# EAGLE design Melting Point (EAGLE 9.7.0)
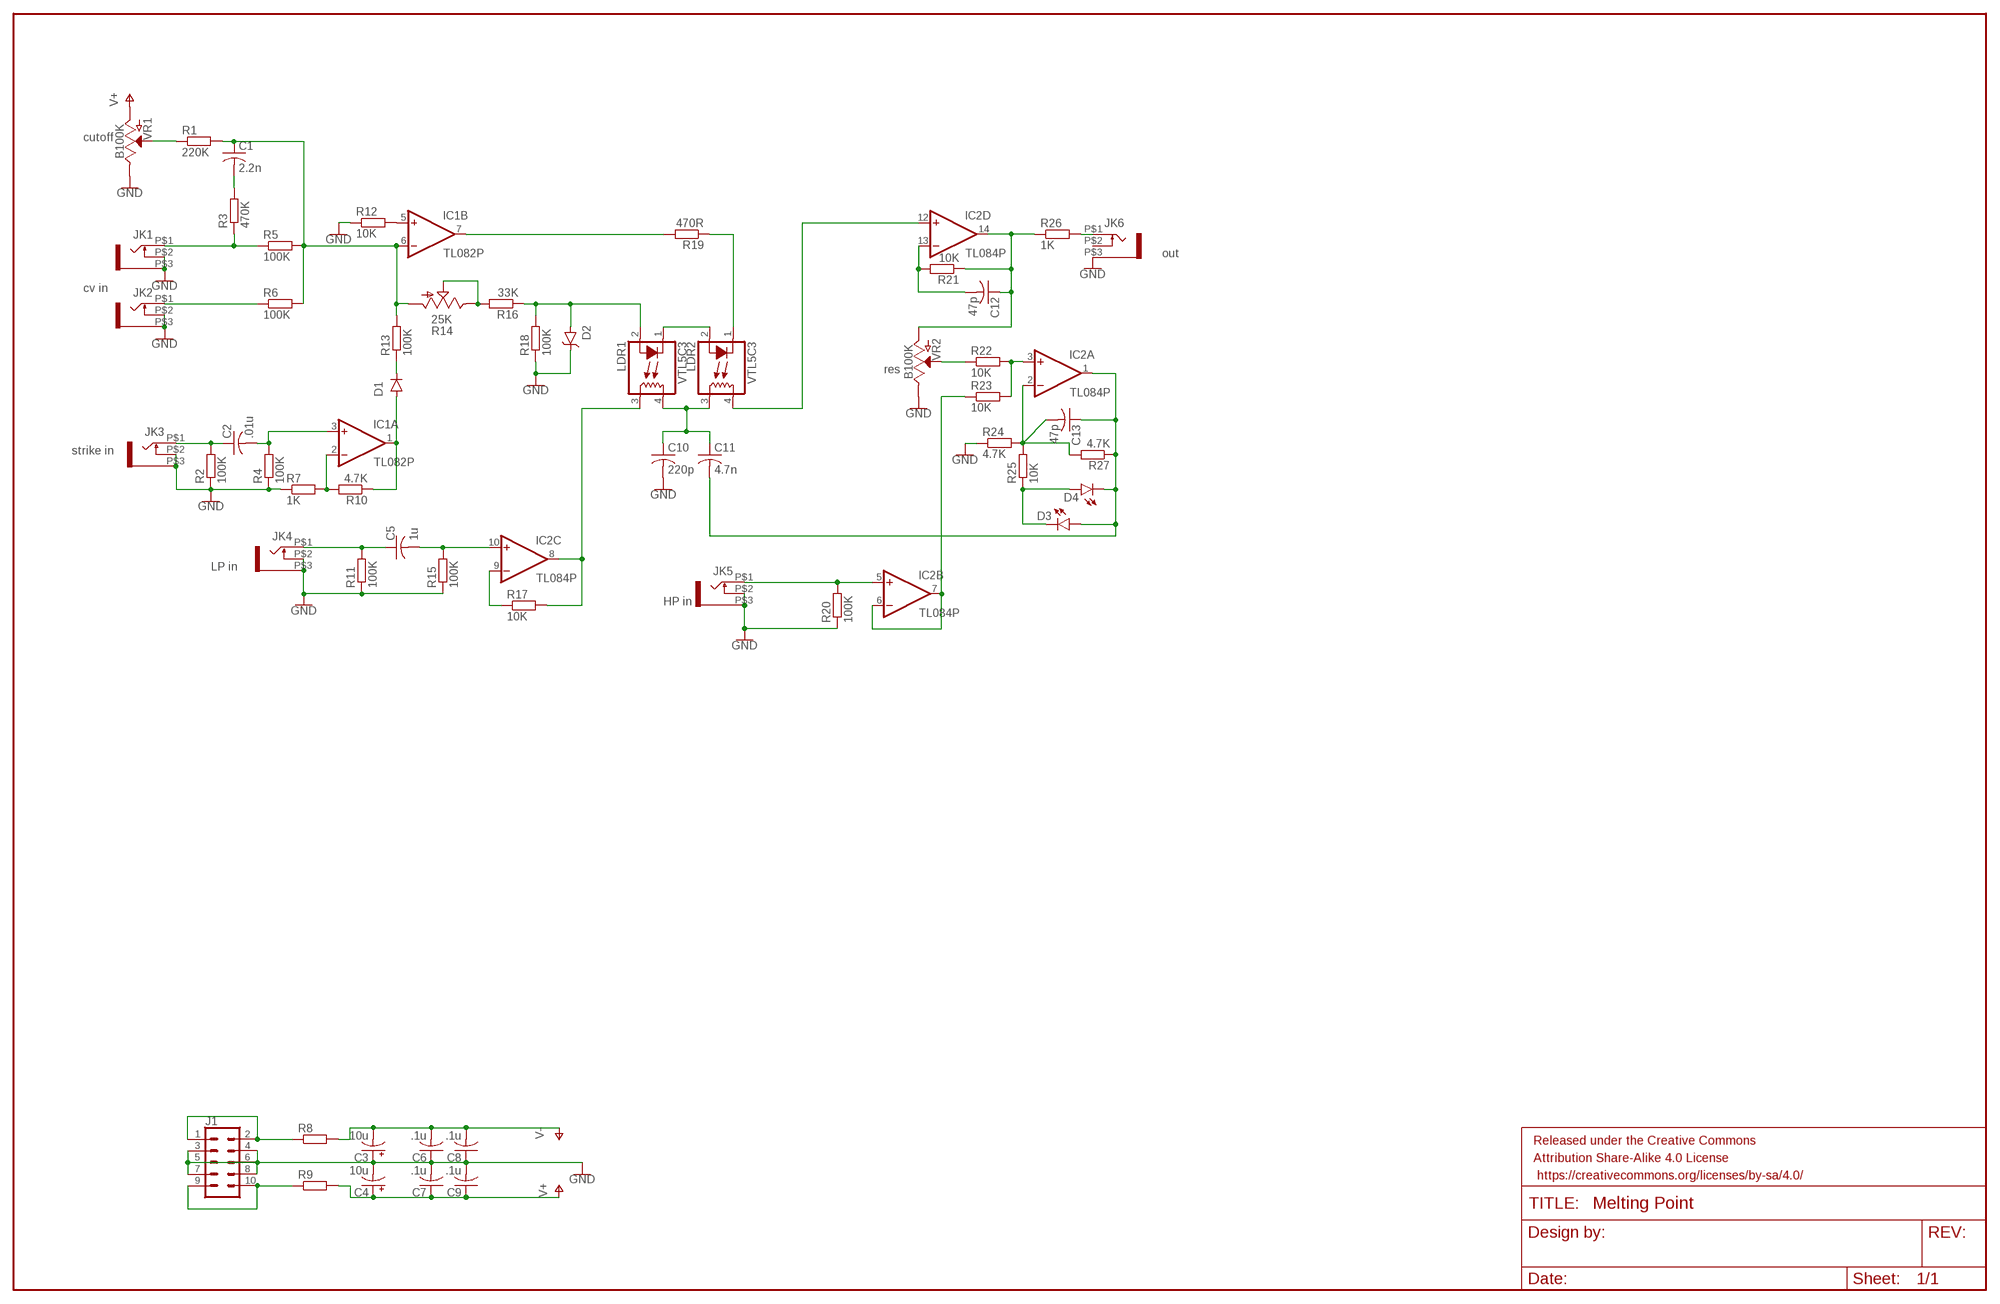
[diagram p0: schematic, sheet 1]

## Parts
C1  2.2n  C-US025-025X050  [C025-025X050]
C2  .01u  C-US025-025X050  [C025-025X050]
C3  10u  CPOL-USE2.5-6  [E2,5-6]
C4  10u  CPOL-USE2.5-6  [E2,5-6]
C5  1u  C-US050-045X075  [C050-045X075]
C6  .1u  C-US025-025X050  [C025-025X050]
C7  .1u  C-US025-025X050  [C025-025X050]
C8  .1u  C-US025-025X050  [C025-025X050]
C9  .1u  C-US025-025X050  [C025-025X050]
C10  220p  C-US050-025X075  [C050-025X075]
C11  4.7n  C-US050-025X075  [C050-025X075]
C12  47p  C-US025-025X050  [C025-025X050]
C13  47p  C-US025-025X050  [C025-025X050]
D1  1N4148DO35-7  [DO35-7]
D2  1N4732A-TAP  [DO-41]
D3  LED3MM  [LED_3MM]
D4  LED3MM  [LED_3MM]
FRAME1  FRAME-LEDGERNO_FOOTPRINT  [DUMMY]
IC1  TL082P  [DIL08]
IC2  TL084P  [DIL14]
J1  CONN_05X2PTH  [2X5]
JK1  WQP-PJ301M-12_JACK  [WQP-PJ301M-12_JACK]
JK2  WQP-PJ301M-12_JACK  [WQP-PJ301M-12_JACK]
JK3  WQP-PJ301M-12_JACK  [WQP-PJ301M-12_JACK]
JK4  WQP-PJ301M-12_JACK  [WQP-PJ301M-12_JACK]
JK5  WQP-PJ301M-12_JACK  [WQP-PJ301M-12_JACK]
JK6  WQP-PJ301M-12_JACK  [WQP-PJ301M-12_JACK]
LDR1  VTL5C3  VTL5C9  [VTL5C]
LDR2  VTL5C3  VTL5C9  [VTL5C]
R1  220K  R-EU_0207/10  [0207/10]
R2  100K  R-EU_0207/10  [0207/10]
R3  470K  R-EU_0207/10  [0207/10]
R4  100K  R-EU_0207/10  [0207/10]
R5  100K  R-EU_0207/10  [0207/10]
R6  100K  R-EU_0207/10  [0207/10]
R7  1K  R-EU_0207/10  [0207/10]
R8  R-EU_0207/10  [0207/10]
R9  R-EU_0207/10  [0207/10]
R10  4.7K  R-EU_0207/10  [0207/10]
R11  100K  R-EU_0207/10  [0207/10]
R12  10K  R-EU_0207/10  [0207/10]
R13  100K  R-EU_0207/10  [0207/10]
R14  25K  TRIM_US-CA6V  [CA6V]
R15  100K  R-EU_0207/10  [0207/10]
R16  33K  R-EU_0207/10  [0207/10]
R17  10K  R-EU_0207/10  [0207/10]
R18  100K  R-EU_0207/10  [0207/10]
R19  470R  R-EU_0207/10  [0207/10]
R20  100K  R-EU_0207/10  [0207/10]
R21  10K  R-EU_0207/10  [0207/10]
R22  10K  R-EU_0207/10  [0207/10]
R23  10K  R-EU_0207/10  [0207/10]
R24  4.7K  R-EU_0207/10  [0207/10]
R25  10K  R-EU_0207/10  [0207/10]
R26  1K  R-EU_0207/10  [0207/10]
R27  4.7K  R-EU_0207/10  [0207/10]
VR1  B100K  POTENTIOMETER-PTH-9MM-1/20W-20%  [POT-PTH-ALPS]
VR2  B100K  POTENTIOMETER-PTH-9MM-1/20W-20%  [POT-PTH-ALPS]

## Nets
GND: C3.+ C4.- C6.1 C7.2 C8.1 C9.2 C10.2 D2.C J1.3 J1.4 J1.5 J1.6 J1.7 J1.8 JK1.P$2 JK1.P$3 JK2.P$2 JK2.P$3 JK3.P$2 JK3.P$3 JK4.P$2 JK4.P$3 JK5.P$2 JK5.P$3 JK6.P$3 R2.1 R4.1 R7.1 R11.1 R12.1 R15.1 R18.1 R20.1 R24.1 VR1.P$1(E) VR2.P$1(E)
N$1: J1.1 J1.2 R8.1
N$2: J1.9 J1.10 R9.1
N$3: D1.A IC1.1(A:OUT) R10.1
N$4: JK2.P$1 R6.1
N$5: IC1.5(B:+IN) R12.2
N$6: C2.1 JK3.P$1 R2.2
N$7: C2.2 IC1.3(A:+IN) R4.2
N$8: C12.1 IC2.14(D:OUT) R21.1 R26.1 VR2.P$3(A)
N$9: IC1.2(A:-IN) R7.2 R10.2
N$10: R22.1 VR2.P$2(S)
N$12: D1.C R13.1
N$14: IC2.5(B:+IN) JK5.P$1 R20.2
N$16: IC2.6(B:-IN) IC2.7(B:OUT) R23.1
N$21: C11.2 C13.1 D3.A D4.K(C) IC2.1(A:OUT) R27.1
N$29: C1.1 IC1.6(B:-IN) R1.2 R5.2 R6.2 R13.2 R14.A
N$30: D3.K(C) D4.A R25.1
N$31: R14.E R14.S R16.2
N$34: D2.A LDR1.2(A) R16.1 R18.2
N$35: LDR1.1(C) LDR2.2(A)
N$36: IC1.7(B:OUT) R19.2
N$37: LDR2.1(C) R19.1
N$39: C5.2 IC2.10(C:+IN) R15.2
N$40: IC2.9(C:-IN) R17.1
N$41: IC2.8(C:OUT) LDR1.3(L1) R17.2
N$42: C10.1 C11.1 LDR1.4(L2) LDR2.3(L1)
N$43: IC2.12(D:+IN) LDR2.4(L2)
N$44: C12.2 IC2.13(D:-IN) R21.2
N$45: IC2.3(A:+IN) R22.2 R23.2
N$47: C13.2 IC2.2(A:-IN) R24.2 R25.2 R27.2
N$57: R1.1 VR1.P$2(S)
N$59: JK1.P$1 R3.1 R5.1
N$60: C1.2 R3.2
N$61: C5.1 JK4.P$1 R11.2
N$64: JK6.P$1 R26.2
V+: C4.+ C7.1 C9.1 R9.2 VR1.P$3(A)
V-: C3.- C6.2 C8.2 R8.2
Unconnected: JK6.P$2

## Notes on the sheet
- cutoff
- out
- cv in
- res
- strike in
- LP in
- HP in

## Power pins joined to a net without a drawn wire
V+: IC1.8(P:V+) IC2.4(P:V+)
V-: IC1.4(P:V-) IC2.11(P:V-)

## Library data of the parts
C1 C2 C5-C13 = rcl:C-US: CAPACITOR, American symbol; SPICEPREFIX: C
C3 C4 = rcl:CPOL-US: POLARIZED CAPACITOR, American symbol; SPICEPREFIX: C
D1 = diode:1N4148: DIODE high speed (Philips)
D2 = Diodes-2:1N4732A-TAP: DIODE ZENER 4.7V 1.3W DO41 Manufacturer's datasheet <https://www.vishay.com/docs/85816/1n4728a.pdf>; CREATED_BY: PCBLayout.com; DIGIKEY_PART_NUMBER: 1N4732A-TAPGICT-ND; MANUFACTURER: Vishay General Semiconductor - Diodes Division; MPN: 1N4732A-TAP; PACKAGE: DO-41
D3 D4 = SparkFun-LED:LED: LED (Generic) Standard schematic elements and footprints for 5mm, 3mm, 1206, and 0603 sized LEDs. Generic LEDs with no color specified.; PROD_ID: DIO-08794
FRAME1 = SparkFun-Aesthetics:FRAME-LEDGER: Schematic Frame - Ledger Standard 11x14 US Ledger frame
IC1 = linear:TL082: OP AMP Data sheet <http://www.ti.com/lit/ds/symlink/tl084a . pdf>; DATA_SHEET: <a href="http://www.ti.com/lit/ds/symlink/tl084a.pdf"> Data sheet </a>
IC2 = linear:TL084: OP AMP
J1 = SparkFun-Connectors:CONN_05X2: Multi connection point. Often used as Generic Header-pin footprint for 0.1 inch spaced/style header connections For AVR SPI programming port, see special device with nice symbol: "AVR_SPI_PROG_5x2.dev" You can populate with any combo of single row headers, but if you'd like an exact match, check these: 2x5 AVR ICSP Male Header <https://www.sparkfun.com/products/778> (PRT-00778) 2x5 Pin Shrouded Header <https://www.sparkfun.com/products/8506> (PRT-08506) On any of the 0.1 inch spaced packages, you can populate with these: Break Away Headers - Straight <https://www.sparkfun.com/products/116> (PRT-00116) Break Away Male Headers - Right Angle <https://www.sparkfun.com/products/553> (PRT-00553) Female Headers <https://www.sparkfun.com/products/115> (PRT-00115) Break Away Headers - Machine Pin <https://www.sparkfun.com/products/117> (PRT-00117) Break Away Female Headers - Swiss Machine Pin <https://www.sparkfun.com/products/743> (PRT-00743) Special note: the shrouded connector mates well with our 5x2 ribbon cables: 2x5 Pin IDC Ribbon Cable <https://www.sparkfun.com/products/8535> (PRT-08535); PROD_ID: CONN-08499; SF_ID: PRT-0778
JK1-JK6 = thonkiconn:WQP-PJ301M-12_JACK
LDR1 LDR2 = optocoupler:VTL5C*: Low Cost Axial Vactrols Source: www.perkinelmer.com/opto ... vtl5c9_c10.pdf; MF: VACTEC PHOTO; MPN: VTL5C9; OC_FARNELL: 2067857; OC_NEWARK: 95F9033
R1-R13 R15-R27 = rcl:R-EU_: RESISTOR, European symbol; SPICEPREFIX: R
R14 = pot:TRIM_US-: POTENTIOMETER
VR1 VR2 = SparkFun-Resistors:POTENTIOMETER: Potentiometer (Pot) Three-terminal potentiometers, with an adjustable wiper and two adjustable resistors. A pot can be used to create a configurable voltage divider, or as a variable resistor. Variants ALPS_POT and ALPS_POT_KIT - PTH, breadboard compatible, 9mm square pots Rotary Potentiometer - Linear (10k ohm) <https://www.sparkfun.com/products/9288> (COM-09288) The KIT variant exposes copper on only one side of the PTH pad, so the part can only be assembled on one side of the PCB. Useful for beginner soldering kits.; PROD_ID: RES-09177; SF_SKU: COM-09288; VALUE: 10k

## Board
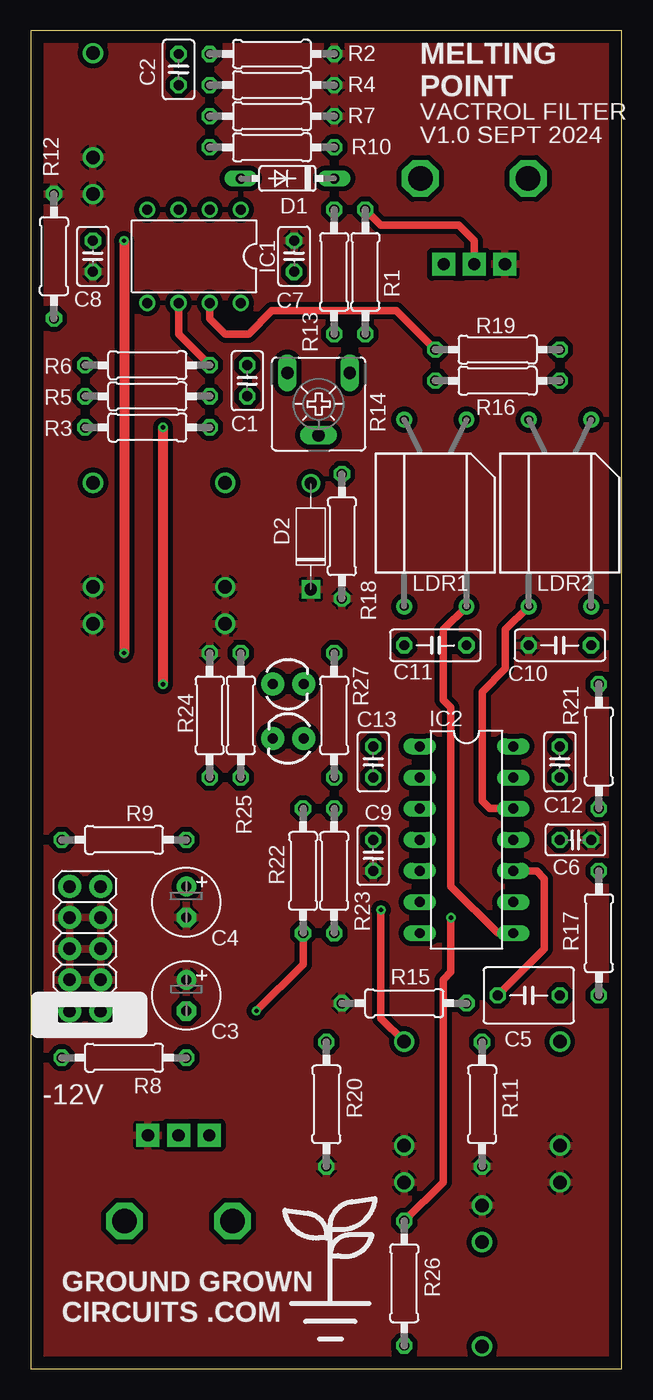
[diagram p1: board, top side]
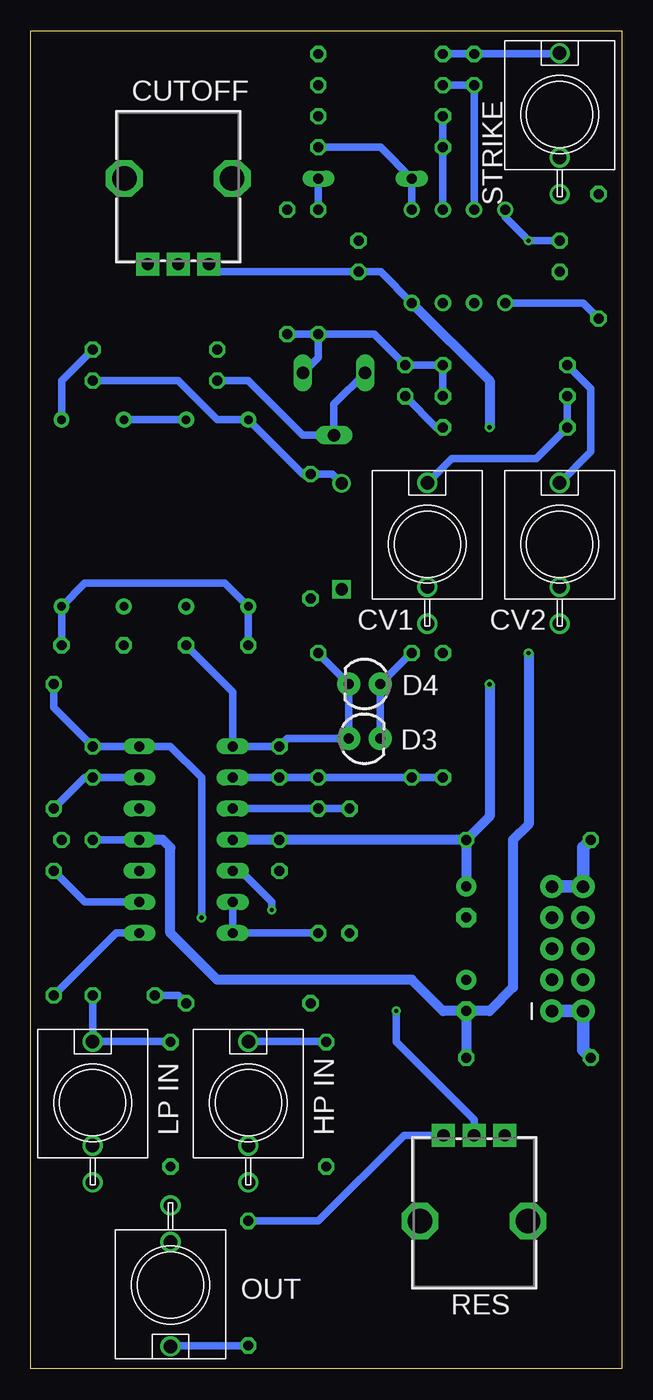
[diagram p2: board, bottom side, seen from below]

Size 48.24 x 109.22 mm. Coordinates in mm from the lower left corner, seen from the top.
Outline: 0,0 48.24,0 48.24,109.22 0,109.22 0,0
Copper layers (1*16): Top 0.035mm / dielectric 1.5mm / Bottom 0.035mm
Design rules "Fusion Electronics Design Rules": minimum track width 6mil, minimum drill 0.35mm, track to track 6mil, track to pad 6mil, pad to pad 6mil, via to via 6mil, smd to smd 6mil, copper to edge 40mil, drill to drill 6mil, minimum pad ring 10mil, minimum via ring 8mil, stop-mask expansion 4mil, vias tented up to drill 0mil, thermal gap 10mil

### Footprints (pad centres in the part's own frame; a part is rotated, then mirrored left to right if it is on the bottom)
C025-025X050 = drill 0.813 octagon: 1 -1.27,0; 2 1.27,0
E2,5-6 = drill 0.813 pad 1.6: + -1.27,0 | drill 0.813 pad 1.6 octagon: - 1.27,0
C050-045X075 = drill 0.813 octagon: 1 -2.54,0; 2 2.54,0
C050-025X075 = drill 0.813 octagon: 1 -2.54,0; 2 2.54,0
DO35-7 = drill 0.813 long: A 3.81,0; C -3.81,0
DO-41 = drill 1: A 4.325,0 | drill 1 square: C -4.325,0
LED_3MM = drill 0.813 pad 1.88: A -1.27,0; K 1.27,0
DIL08 = drill 0.813 pad 1.27: 1 -3.81,-3.81; 2 -1.27,-3.81; 3 1.27,-3.81; 4 3.81,-3.81; 5 3.81,3.81; 6 1.27,3.81; 7 -1.27,3.81; 8 -3.81,3.81
DIL14 = drill 0.813 long: 1 -7.62,-3.81; 2 -5.08,-3.81; 3 -2.54,-3.81; 4 0,-3.81; 5 2.54,-3.81; 6 5.08,-3.81; 7 7.62,-3.81; 8 7.62,3.81; 9 5.08,3.81; 10 2.54,3.81; 11 0,3.81; 12 -2.54,3.81; 13 -5.08,3.81; 14 -7.62,3.81
2X5 = drill 1.016 pad 1.88: 1 0,0; 2 0,2.54; 3 2.54,0; 4 2.54,2.54; 5 5.08,0; 6 5.08,2.54; 7 7.62,0; 8 7.62,2.54; 9 10.16,0; 10 10.16,2.54
WQP-PJ301M-12_JACK = drill 1.1: P$1 0,5; P$2 0,-3.5; P$3 0,-6.5
VTL5C = drill 0.7 pad 1.3: 1 -7.62,2.54; 2 -7.62,-2.54; 3 7.62,2.54; 4 7.62,-2.54
0207/10 = drill 0.813 octagon: 1 -5.08,0; 2 5.08,0
CA6V = drill 1.016 long: A -2.54,-2.54; E 2.54,-2.54; S 0,2.54
POT-PTH-ALPS = drill 1 pad 1.88 square: P$1 7,-2.5; P$2 7,0; P$3 7,2.5 | drill 2 octagon: P$4 0,-4.4; P$5 0,4.4

### Placement (x,y rotation side)
C1  17.68,80.64 270 top
C2  12.06,106.05 270 top
C3  12.7,30.48 270 top
C4  12.7,38.1 270 top
C5  40.64,30.48 180 top
C6  44.45,43.18 180 top
C7  21.49,90.81 90 top
C8  5.08,90.81 90 top
C9  27.94,41.91 270 top
C10  43.18,59.05 180 top
C11  33.02,59.05 0 top
C12  43.18,49.53 270 top
C13  27.94,49.53 270 top
D1  20.95,97.16 180 top
D2  22.86,67.94 90 top
D3  21.01,51.44 0 bottom
D4  21.01,55.88 180 bottom
FRAME1  -52.07,82.55 0 top  (outside the outline)
IC1  13.34,90.81 180 top
IC2  35.56,43.18 270 top
J1  5.71,29.21 90 top
JK1  15.88,67.31 0 bottom
JK2  5.08,67.31 0 bottom
JK3  5.08,102.38 0 bottom
JK4  43.18,21.71 0 bottom
JK5  30.48,21.71 0 bottom
JK6  36.83,6.84 180 bottom
LDR1  33.02,69.85 270 top
LDR2  43.18,69.85 270 top
R1  27.3,89.53 270 top
R2  19.68,107.31 180 top
R3  9.53,76.83 0 top
R4  19.68,104.78 180 top
R5  9.53,79.38 0 top
R6  9.53,81.92 0 top
R7  19.68,102.23 180 top
R8  7.62,25.4 0 top
R9  7.62,43.18 0 top
R10  19.68,99.69 180 top
R11  36.83,21.59 90 top
R12  1.91,90.81 270 top
R13  24.77,89.53 270 top
R14  23.5,78.74 180 top
R15  30.48,29.84 0 top
R16  38.1,80.64 180 top
R17  46.35,35.56 270 top
R18  25.4,67.94 90 top
R19  38.1,83.19 180 top
R20  24.13,21.59 90 top
R21  46.35,50.8 270 top
R22  22.23,40.64 90 top
R23  24.77,40.64 90 top
R24  14.61,53.34 270 top
R25  17.14,53.34 270 top
R26  30.48,6.99 270 top
R27  24.77,53.34 270 top
U$1  [LOGO_MED]  24.45,5.4 0 top
VR1  36.2,97.16 270 bottom
VR2  12.06,12.06 90 bottom

### Tracks (layer width: path | path; a pad name or v marks a point on that pad's centre or on a via)
GND
  pour Top (isolate 0.406): 0.3,0.3 47.96,0.3 47.96,108.92 0.3,108.92
N$1
  Bottom 1.016: R8.1 3.17,26.04 J1.2 J1.1
N$2
  Bottom 1.016: R9.1 3.17,42.55 J1.10 J1.9
N$3
  Bottom 0.61: IC1.1 D1.A 19.68,99.69 R10.1
N$4
  Bottom 0.61: JK2.P$1 2.54,74.85 2.54,80.01 R6.1
N$5
  Bottom 0.61: R12.2 3.17,87 IC1.5
N$6
  Bottom 0.61: R2.2 C2.1 5.14,107.31 JK3.P$1
N$7
  Bottom 0.61: IC1.3 C2.2 R4.2
N$8  (via drill 0.35)
  Top 0.61: R26.1 33.66,15.24 33.66,31.75 34.29,32.38 v34.29,36.83
  Bottom 0.61: R21.1 46.35,53.98 C12.1 IC2.14 36.83,50.8 34.29,48.26 v34.29,36.83 | R26.1 24.77,12.06 17.77,19.07 VR2.P$3
N$9
  Bottom 0.61: R7.2 R10.2 IC1.2
N$10  (via drill 0.35)
  Top 0.61: R22.1 22.23,33.02 v18.41,29.21
  Bottom 0.61: v18.41,29.21 18.41,26.67 12.06,20.32 VR2.P$2
N$12
  Bottom 0.61: D1.C R13.1
N$14  (via drill 0.35)
  Top 0.61: v28.57,37.47 28.57,28.62 JK5.P$1
  Bottom 0.61: IC2.5 31.11,40.64 28.57,38.1 v28.57,37.47 | R20.2 24.17,26.71 JK5.P$1
N$16
  Bottom 0.61: IC2.6 IC2.7 R23.1
N$21
  Bottom 0.61: R27.1 24.77,58.37 D4.K D3.A 27.3,51.44 C13.1 IC2.1 31.75,55.24 C11.2
N$29
  Top 0.61: R6.2 12.06,84.45 IC1.6
  Bottom 0.61: R5.2 R6.2 C1.1 20.22,84.45 R13.2 | R13.2 R1.2 | R14.A 24.77,82.55 R13.2
N$30
  Bottom 0.61: D3.K D4.A 17.2,58.42 R25.1
N$31
  Bottom 0.61: R14.E 23.5,78.74 R14.S 26.04,76.2 30.48,80.64 R16.2
N$34
  Bottom 0.61: R16.1 36.2,80.64 33.02,77.47 LDR1.2 26.04,73.03 R18.2 23.61,73.03 D2.A
N$35
  Bottom 0.61: LDR1.1 LDR2.2
N$36
  Top 0.61: IC1.7 14.61,85.72 15.88,84.45 17.78,84.45 19.68,86.36 29.84,86.36 R19.2
N$37
  Bottom 0.61: R19.1 45.72,80.64 LDR2.1
N$39
  Top 0.61: C5.2 41.91,34.29 41.91,40.01 41.27,40.64 IC2.10
  Bottom 0.61: R15.2 36.2,30.48 C5.2
N$40
  Bottom 0.61: IC2.9 43.81,38.1 R17.1
N$41
  Top 0.61: LDR1.3 33.66,60.33 33.66,54.61 34.29,53.98 34.29,39.37 38.1,35.56 IC2.8
  Bottom 0.61: IC2.8 41.27,35.56 R17.2
N$42
  Bottom 0.61: C11.1 LDR1.4 32.38,64.14 43.81,64.14 LDR2.3 C10.1
N$43
  Top 0.61: IC2.12 37.47,45.72 36.83,46.35 36.83,55.24 38.73,57.15 38.73,60.33 LDR2.4
N$44
  Bottom 0.61: IC2.13 C12.2 43.81,48.26 R21.2
N$45
  Bottom 0.61: R22.2 R23.2 IC2.3
N$47
  Bottom 0.61: R24.2 R25.2 R27.2 C13.2 IC2.2
N$57
  Top 0.61: R1.1 28.57,93.34 34.92,93.34 36.2,92.08 VR1.P$2
N$59
  Bottom 0.61: R5.1 R3.1 6.99,74.3 13.89,74.3 JK1.P$1
N$60
  Bottom 0.61: C1.2 15.14,76.83 R3.2
N$61
  Bottom 0.61: R11.2 36.87,26.71 JK4.P$1 C5.1
N$64
  Bottom 0.61: R26.2 36.77,1.91 JK6.P$1
V+  (via drill 0.35)
  Top 0.813: v10.79,76.83 v10.79,55.88
  Bottom 0.61: VR1.P$3 33.08,89.53 C7.1 19.68,89.53 IC1.8
  Bottom 0.813: IC1.8 10.79,80.64 v10.79,76.83 | v10.79,55.88 10.79,45.09 R9.2 | R9.2 C4.+ | R9.2 C9.1 IC2.4
V-  (via drill 0.35)
  Top 0.813: v7.62,92.08 v7.62,58.42
  Bottom 0.61: IC1.4 9.53,93.98 v7.62,92.08 C8.2 | IC2.11 C6.2
  Bottom 0.813: C3.- R8.2 | v7.62,58.42 7.62,44.45 8.89,43.18 8.89,31.11 10.79,29.21 C3.- | C3.- 14.61,29.21 17.14,31.75 33.02,31.75 36.83,35.56 36.83,42.55 37.47,43.18 IC2.11

### Text on the board
tPlace: MELTING / POINT | VACTROL FILTER | V1.0 SEPT 2024 | -12V | GROUND GROWN / CIRCUITS .COM
bPlace: STRIKE | CUTOFF | CV2 | CV1 | HP IN | LP IN | OUT | RES